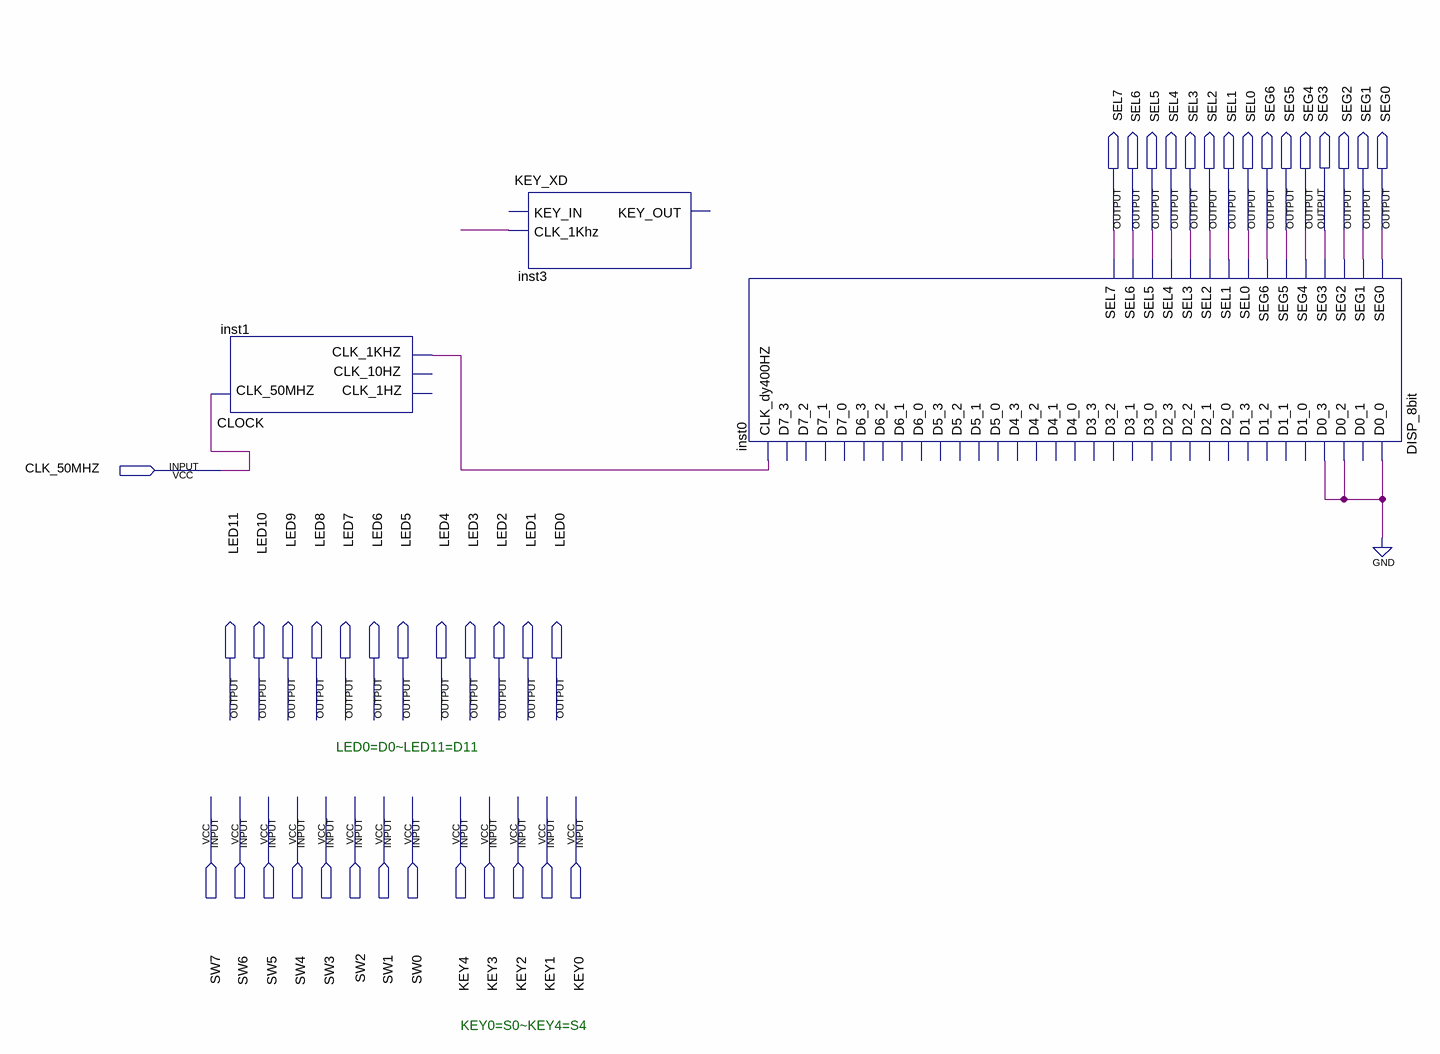
[diagram p0: schematic sheet]
// Quartus schematic template_experiment_AC101.bdf as structural Verilog: 3 symbols, 41 pins
module template_experiment_AC101 (
  input  CLK_50MHZ,
  input  SW7,
  input  SW6,
  input  SW5,
  input  SW4,
  input  SW3,
  input  SW2,
  input  SW1,
  input  SW0,
  input  KEY4,
  input  KEY3,
  input  KEY2,
  input  KEY1,
  input  KEY0,
  output SEL7,
  output SEL6,
  output SEL5,
  output SEL4,
  output SEL3,
  output SEL2,
  output SEL1,
  output SEL0,
  output SEG6,
  output SEG5,
  output SEG4,
  output SEG3,
  output SEG2,
  output SEG1,
  output SEG0,
  output LED11,
  output LED10,
  output LED9,
  output LED8,
  output LED7,
  output LED6,
  output LED5,
  output LED4,
  output LED3,
  output LED2,
  output LED1,
  output LED0
);

  wire inst1_clk_1khz, undriven;

  CLOCK inst1 (.CLK_50MHZ(CLK_50MHZ), .CLK_1KHZ(inst1_clk_1khz));  // open: CLK_1HZ, CLK_10HZ
  KEY_XD inst3 (.CLK_1Khz(undriven));  // open: KEY_IN, KEY_OUT
  DISP_8bit inst0 (
    .D0_0(1'b0), .D0_2(1'b0), .D0_3(1'b0), .CLK_dy400HZ(inst1_clk_1khz), .SEG0(SEG0), .SEG1(SEG1),
    .SEG2(SEG2), .SEG3(SEG3), .SEG4(SEG4), .SEG5(SEG5), .SEG6(SEG6), .SEL0(SEL0), .SEL1(SEL1), .SEL2(SEL2),
    .SEL3(SEL3), .SEL4(SEL4), .SEL5(SEL5), .SEL6(SEL6), .SEL7(SEL7));  // open: D0_1, D1_0, D1_1, D1_2, D1_3, D2_0, D2_1, D2_2, D2_3, D3_0, D3_1, D3_2, D3_3, D4_0, D4_1, D4_2, D4_3, D5_0, D5_1, D5_2, D5_3, D6_0, D6_1, D6_2, D6_3, D7_0, D7_1, D7_2, D7_3

  // Notes on the sheet:
  //   LED0=D0~LED11=D11
  //   KEY0=S0~KEY4=S4
endmodule
